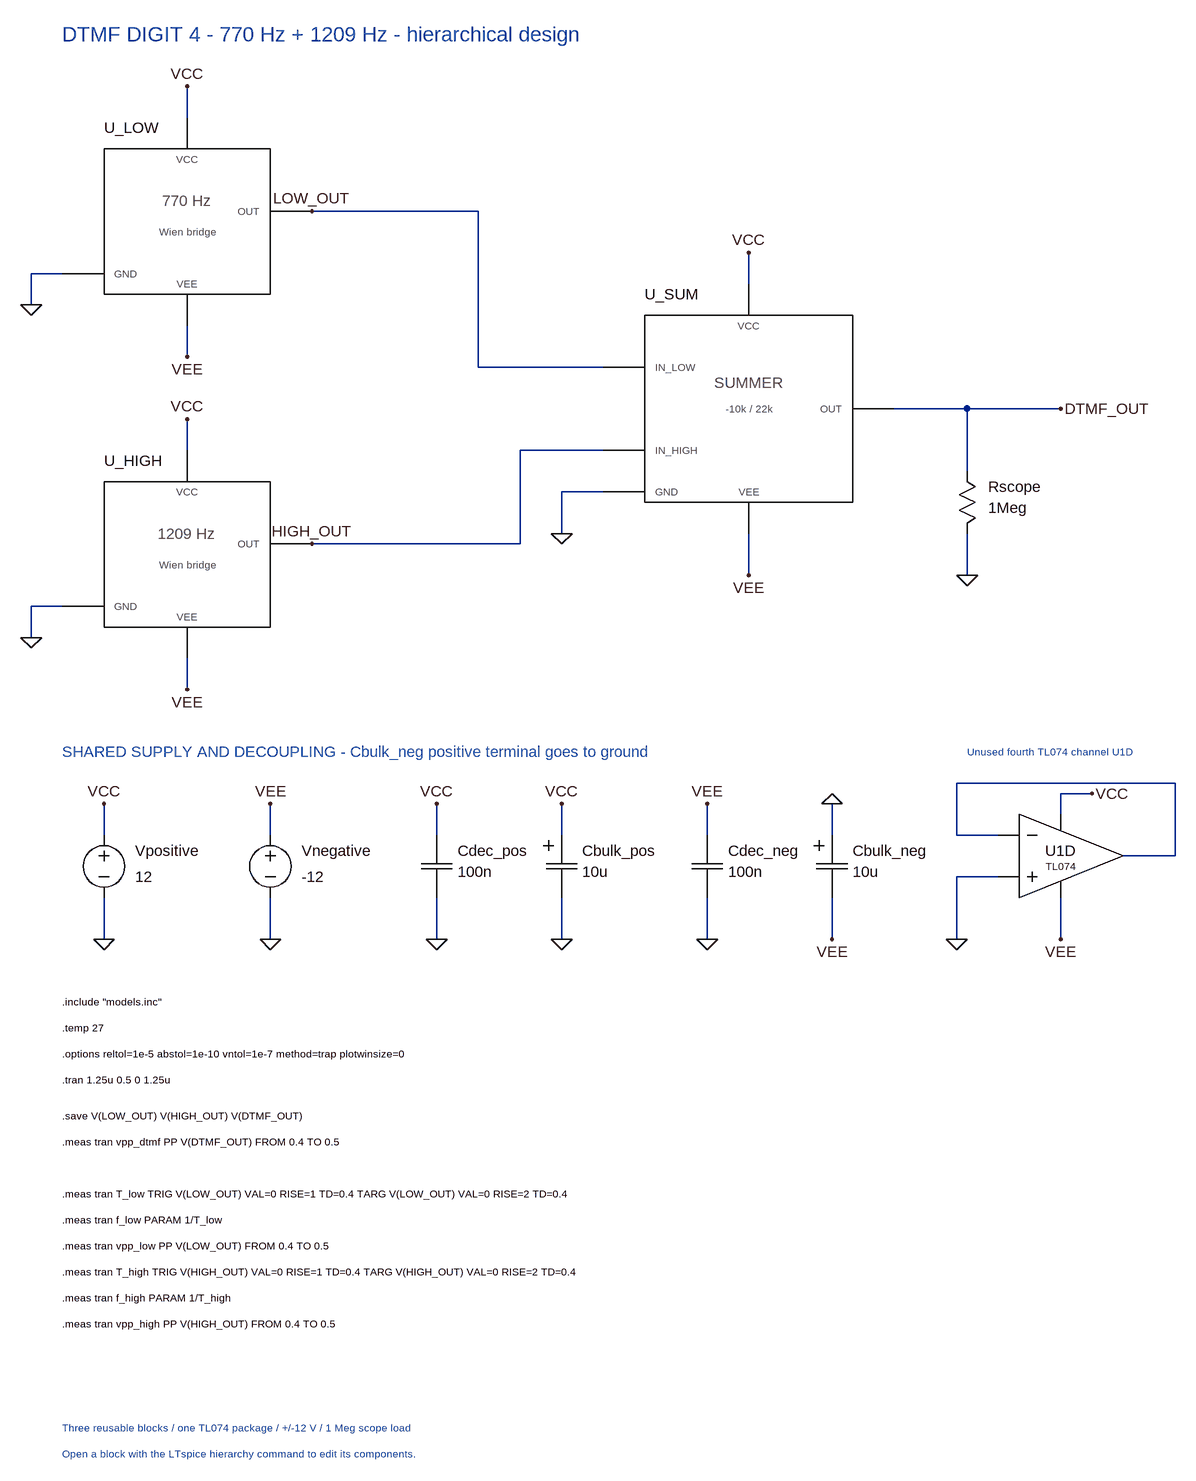
[diagram p0: schematic DTMF4.asc]
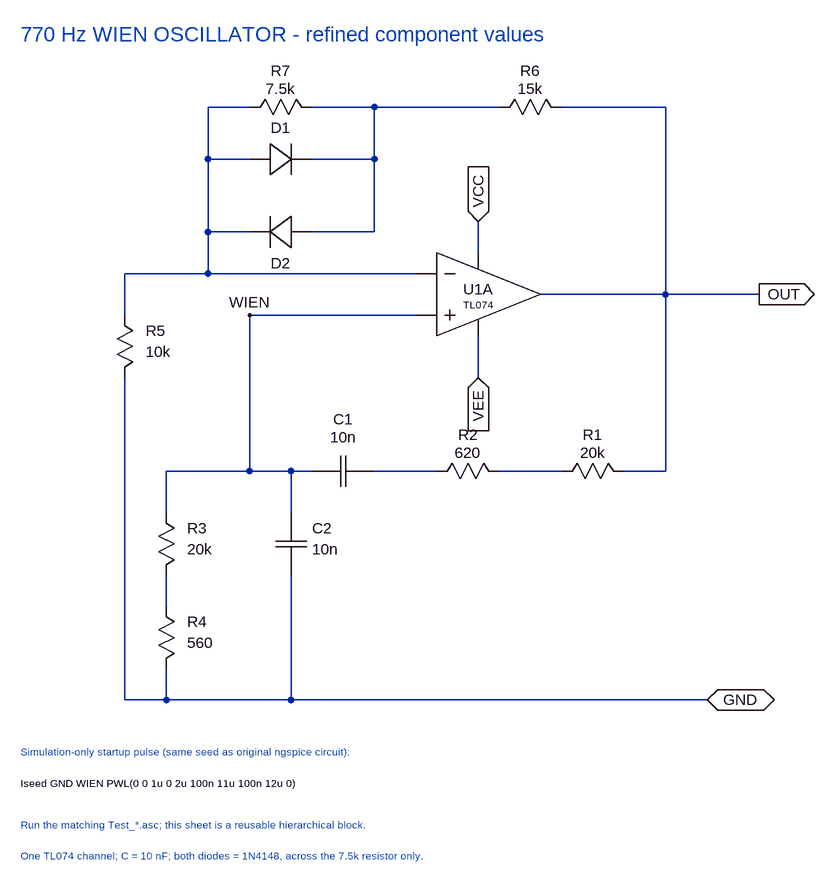
[diagram p1: sub-circuit lowoscillator.asc]
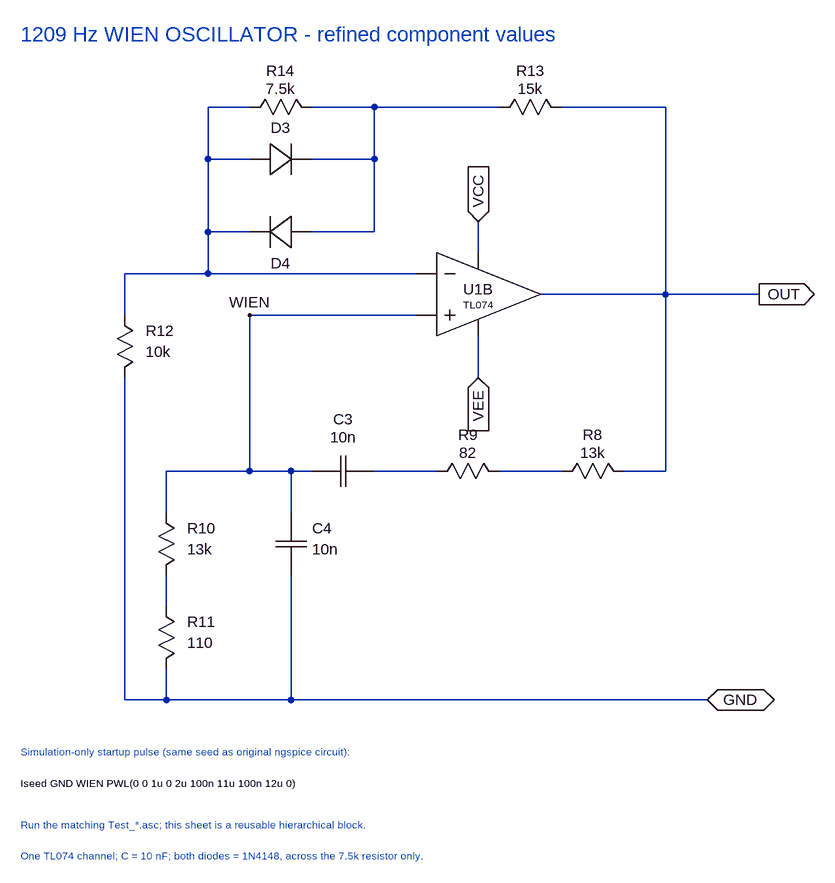
[diagram p2: sub-circuit highoscillator.asc]
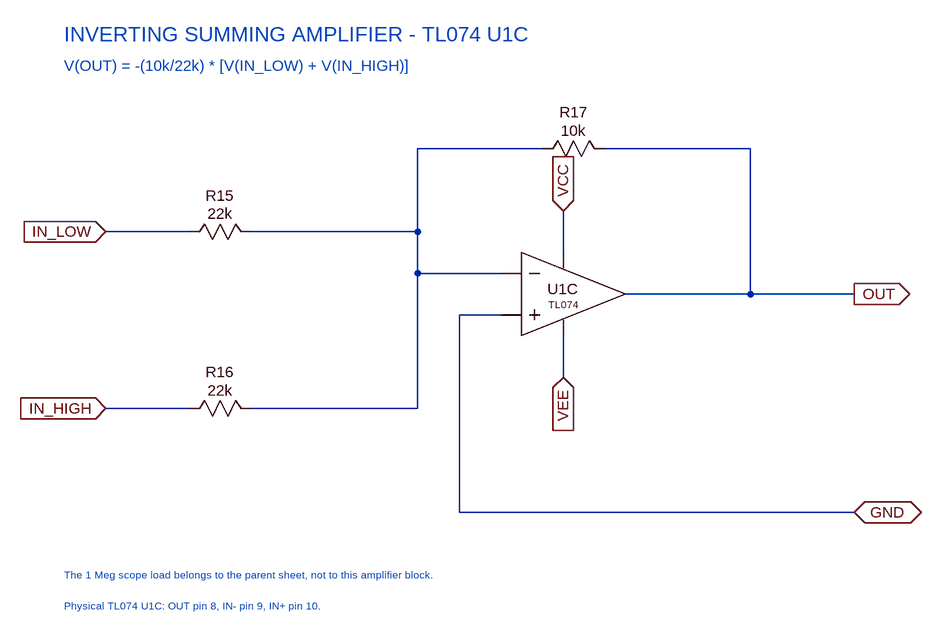
[diagram p3: sub-circuit summingamplifier.asc]
DTMF4.asc, the LTspice schematic file:
Version 4
SHEET 1 2208 2256
WIRE 256 144 256 96
WIRE 256 464 256 512
WIRE 64 384 16 384
WIRE 16 384 16 432
WIRE 256 656 256 608
WIRE 256 976 256 1024
WIRE 64 896 16 896
WIRE 16 896 16 944
WIRE 1120 400 1120 352
WIRE 1120 784 1120 848
WIRE 896 720 832 720
WIRE 832 720 832 784
WIRE 448 288 704 288
WIRE 704 288 704 528
WIRE 704 528 896 528
WIRE 448 800 768 800
WIRE 768 800 768 656
WIRE 768 656 896 656
WIRE 1344 592 1456 592
WIRE 1456 592 1600 592
WIRE 1456 592 1456 688
WIRE 1456 784 1456 848
WIRE 128 1248 128 1200
WIRE 128 1344 128 1408
WIRE 384 1248 384 1200
WIRE 384 1344 384 1408
WIRE 640 1248 640 1200
WIRE 640 1344 640 1408
WIRE 832 1248 832 1200
WIRE 832 1344 832 1408
WIRE 1056 1248 1056 1200
WIRE 1056 1344 1056 1408
WIRE 1248 1248 1248 1200
WIRE 1248 1344 1248 1408
WIRE 1504 1248 1440 1248
WIRE 1440 1248 1440 1168
WIRE 1440 1168 1776 1168
WIRE 1776 1168 1776 1280
WIRE 1776 1280 1696 1280
WIRE 1504 1312 1440 1312
WIRE 1440 1312 1440 1408
WIRE 1600 1216 1600 1184
WIRE 1600 1184 1648 1184
WIRE 1600 1344 1600 1408
FLAG 256 96 VCC
FLAG 256 512 VEE
FLAG 16 432 0
FLAG 448 288 LOW_OUT
FLAG 256 608 VCC
FLAG 256 1024 VEE
FLAG 16 944 0
FLAG 448 800 HIGH_OUT
FLAG 1120 352 VCC
FLAG 1120 848 VEE
FLAG 832 784 0
FLAG 1600 592 DTMF_OUT
FLAG 1456 848 0
FLAG 128 1200 VCC
FLAG 128 1408 0
FLAG 384 1200 VEE
FLAG 384 1408 0
FLAG 640 1200 VCC
FLAG 640 1408 0
FLAG 832 1200 VCC
FLAG 832 1408 0
FLAG 1056 1200 VEE
FLAG 1056 1408 0
FLAG 1248 1200 0
FLAG 1248 1408 VEE
FLAG 1440 1408 0
FLAG 1648 1184 VCC
FLAG 1600 1408 VEE
SYMBOL LowOscillator 128 192 R0
SYMATTR InstName U_LOW
SYMBOL HighOscillator 128 704 R0
SYMATTR InstName U_HIGH
SYMBOL SummingAmplifier 960 448 R0
SYMATTR InstName U_SUM
SYMBOL R_V 1456 688 R0
SYMATTR InstName Rscope
SYMATTR Value 1Meg
SYMBOL V_Source 128 1248 R0
SYMATTR InstName Vpositive
SYMATTR Value 12
SYMBOL V_Source 384 1248 R0
SYMATTR InstName Vnegative
SYMATTR Value -12
SYMBOL C_V 640 1248 R0
SYMATTR InstName Cdec_pos
SYMATTR Value 100n
SYMBOL C_Polar_V 832 1248 R0
SYMATTR InstName Cbulk_pos
SYMATTR Value 10u
SYMBOL C_V 1056 1248 R0
SYMATTR InstName Cdec_neg
SYMATTR Value 100n
SYMBOL C_Polar_V 1248 1248 R0
SYMATTR InstName Cbulk_neg
SYMATTR Value 10u
SYMBOL TL074_Channel 1504 1216 R0
SYMATTR InstName U1D
TEXT 64 16 Left 3 ;DTMF DIGIT 4 - 770 Hz + 1209 Hz - hierarchical design
TEXT 64 2160 Left 1 ;Three reusable blocks / one TL074 package / +/-12 V / 1 Meg scope load
TEXT 64 1120 Left 2 ;SHARED SUPPLY AND DECOUPLING - Cbulk_neg positive terminal goes to ground
TEXT 1456 1120 Left 1 ;Unused fourth TL074 channel U1D
TEXT 64 1504 Left 1 !.include "models.inc"
TEXT 64 1544 Left 1 !.temp 27
TEXT 64 1584 Left 1 !.options reltol=1e-5 abstol=1e-10 vntol=1e-7 method=trap plotwinsize=0
TEXT 64 1624 Left 1 !.tran 1.25u 0.5 0 1.25u
TEXT 64 1680 Left 1 !.save V(LOW_OUT) V(HIGH_OUT) V(DTMF_OUT)
TEXT 64 1800 Left 1 !.meas tran T_low TRIG V(LOW_OUT) VAL=0 RISE=1 TD=0.4 TARG V(LOW_OUT) VAL=0 RISE=2 TD=0.4
TEXT 64 1840 Left 1 !.meas tran f_low PARAM 1/T_low
TEXT 64 1880 Left 1 !.meas tran vpp_low PP V(LOW_OUT) FROM 0.4 TO 0.5
TEXT 64 1920 Left 1 !.meas tran T_high TRIG V(HIGH_OUT) VAL=0 RISE=1 TD=0.4 TARG V(HIGH_OUT) VAL=0 RISE=2 TD=0.4
TEXT 64 1960 Left 1 !.meas tran f_high PARAM 1/T_high
TEXT 64 2000 Left 1 !.meas tran vpp_high PP V(HIGH_OUT) FROM 0.4 TO 0.5
TEXT 64 1720 Left 1 !.meas tran vpp_dtmf PP V(DTMF_OUT) FROM 0.4 TO 0.5
TEXT 64 2200 Left 1 ;Open a block with the LTspice hierarchy command to edit its components.

lowoscillator.asc, the sub-circuit schematic file:
Version 4
SHEET 1 1344 1328
WIRE 864 416 1056 416
WIRE 1056 416 1200 416
WIRE 1056 416 1056 128
WIRE 1056 128 896 128
WIRE 800 128 608 128
WIRE 608 128 512 128
WIRE 416 128 352 128
WIRE 352 128 352 208
WIRE 352 208 352 320
WIRE 352 320 352 384
WIRE 352 384 672 384
WIRE 352 208 416 208
WIRE 512 208 608 208
WIRE 352 320 416 320
WIRE 512 320 608 320
WIRE 608 128 608 208
WIRE 608 208 608 320
WIRE 352 384 224 384
WIRE 224 384 224 448
WIRE 224 544 224 1040
WIRE 1056 416 1056 688
WIRE 1056 688 992 688
WIRE 896 688 800 688
WIRE 704 688 608 688
WIRE 512 688 480 688
WIRE 480 688 416 688
WIRE 416 688 288 688
WIRE 288 688 288 752
WIRE 416 688 416 448
WIRE 416 448 672 448
WIRE 288 848 288 896
WIRE 288 992 288 1040
WIRE 480 688 480 752
WIRE 480 848 480 1040
WIRE 224 1040 288 1040
WIRE 288 1040 480 1040
WIRE 480 1040 1120 1040
WIRE 768 352 768 304
WIRE 768 480 768 544
FLAG 1200 416 OUT
FLAG 416 448 WIEN
FLAG 1120 1040 GND
FLAG 768 304 VCC
FLAG 768 544 VEE
IOPIN 1200 416 Out
IOPIN 1120 1040 BiDir
IOPIN 768 304 In
IOPIN 768 544 In
SYMBOL TL074_Channel 672 352 R0
SYMATTR InstName U1A
SYMBOL R_H 800 128 R0
SYMATTR InstName R6
SYMATTR Value 15k
SYMBOL R_H 416 128 R0
SYMATTR InstName R7
SYMATTR Value 7.5k
SYMBOL Diode_1N4148 416 208 R0
SYMATTR InstName D1
SYMBOL Diode_1N4148 512 320 R180
SYMATTR InstName D2
SYMBOL R_V 224 448 R0
SYMATTR InstName R5
SYMATTR Value 10k
SYMBOL R_H 896 688 R0
SYMATTR InstName R1
SYMATTR Value 20k
SYMBOL R_H 704 688 R0
SYMATTR InstName R2
SYMATTR Value 620
SYMBOL C_H 512 688 R0
SYMATTR InstName C1
SYMATTR Value 10n
SYMBOL R_V 288 752 R0
SYMATTR InstName R3
SYMATTR Value 20k
SYMBOL R_V 288 896 R0
SYMATTR InstName R4
SYMATTR Value 560
SYMBOL C_V 480 752 R0
SYMATTR InstName C2
SYMATTR Value 10n
TEXT 64 16 Left 3 ;770 Hz WIEN OSCILLATOR - refined component values
TEXT 64 1280 Left 1 ;One TL074 channel; C = 10 nF; both diodes = 1N4148, across the 7.5k resistor only.
TEXT 64 1120 Left 1 ;Simulation-only startup pulse (same seed as original ngspice circuit):
TEXT 64 1168 Left 1 !Iseed GND WIEN PWL(0 0 1u 0 2u 100n 11u 100n 12u 0)
TEXT 64 1232 Left 1 ;Run the matching Test_*.asc; this sheet is a reusable hierarchical block.

highoscillator.asc, the sub-circuit schematic file:
Version 4
SHEET 1 1344 1328
WIRE 864 416 1056 416
WIRE 1056 416 1200 416
WIRE 1056 416 1056 128
WIRE 1056 128 896 128
WIRE 800 128 608 128
WIRE 608 128 512 128
WIRE 416 128 352 128
WIRE 352 128 352 208
WIRE 352 208 352 320
WIRE 352 320 352 384
WIRE 352 384 672 384
WIRE 352 208 416 208
WIRE 512 208 608 208
WIRE 352 320 416 320
WIRE 512 320 608 320
WIRE 608 128 608 208
WIRE 608 208 608 320
WIRE 352 384 224 384
WIRE 224 384 224 448
WIRE 224 544 224 1040
WIRE 1056 416 1056 688
WIRE 1056 688 992 688
WIRE 896 688 800 688
WIRE 704 688 608 688
WIRE 512 688 480 688
WIRE 480 688 416 688
WIRE 416 688 288 688
WIRE 288 688 288 752
WIRE 416 688 416 448
WIRE 416 448 672 448
WIRE 288 848 288 896
WIRE 288 992 288 1040
WIRE 480 688 480 752
WIRE 480 848 480 1040
WIRE 224 1040 288 1040
WIRE 288 1040 480 1040
WIRE 480 1040 1120 1040
WIRE 768 352 768 304
WIRE 768 480 768 544
FLAG 1200 416 OUT
FLAG 416 448 WIEN
FLAG 1120 1040 GND
FLAG 768 304 VCC
FLAG 768 544 VEE
IOPIN 1200 416 Out
IOPIN 1120 1040 BiDir
IOPIN 768 304 In
IOPIN 768 544 In
SYMBOL TL074_Channel 672 352 R0
SYMATTR InstName U1B
SYMBOL R_H 800 128 R0
SYMATTR InstName R13
SYMATTR Value 15k
SYMBOL R_H 416 128 R0
SYMATTR InstName R14
SYMATTR Value 7.5k
SYMBOL Diode_1N4148 416 208 R0
SYMATTR InstName D3
SYMBOL Diode_1N4148 512 320 R180
SYMATTR InstName D4
SYMBOL R_V 224 448 R0
SYMATTR InstName R12
SYMATTR Value 10k
SYMBOL R_H 896 688 R0
SYMATTR InstName R8
SYMATTR Value 13k
SYMBOL R_H 704 688 R0
SYMATTR InstName R9
SYMATTR Value 82
SYMBOL C_H 512 688 R0
SYMATTR InstName C3
SYMATTR Value 10n
SYMBOL R_V 288 752 R0
SYMATTR InstName R10
SYMATTR Value 13k
SYMBOL R_V 288 896 R0
SYMATTR InstName R11
SYMATTR Value 110
SYMBOL C_V 480 752 R0
SYMATTR InstName C4
SYMATTR Value 10n
TEXT 64 16 Left 3 ;1209 Hz WIEN OSCILLATOR - refined component values
TEXT 64 1280 Left 1 ;One TL074 channel; C = 10 nF; both diodes = 1N4148, across the 7.5k resistor only.
TEXT 64 1120 Left 1 ;Simulation-only startup pulse (same seed as original ngspice circuit):
TEXT 64 1168 Left 1 !Iseed GND WIEN PWL(0 0 1u 0 2u 100n 11u 100n 12u 0)
TEXT 64 1232 Left 1 ;Run the matching Test_*.asc; this sheet is a reusable hierarchical block.

summingamplifier.asc, the sub-circuit schematic file:
Version 4
SHEET 1 1472 1008
WIRE 928 416 1120 416
WIRE 1120 416 1280 416
WIRE 1120 416 1120 192
WIRE 1120 192 896 192
WIRE 800 192 608 192
WIRE 608 192 608 384
WIRE 608 384 736 384
WIRE 128 320 256 320
WIRE 352 320 608 320
WIRE 128 592 256 592
WIRE 352 592 608 592
WIRE 608 592 608 384
WIRE 736 448 672 448
WIRE 672 448 672 752
WIRE 672 752 1280 752
WIRE 832 352 832 288
WIRE 832 480 832 544
FLAG 1280 416 OUT
FLAG 128 320 IN_LOW
FLAG 128 592 IN_HIGH
FLAG 1280 752 GND
FLAG 832 288 VCC
FLAG 832 544 VEE
IOPIN 1280 416 Out
IOPIN 128 320 In
IOPIN 128 592 In
IOPIN 1280 752 BiDir
IOPIN 832 288 In
IOPIN 832 544 In
SYMBOL TL074_Channel 736 352 R0
SYMATTR InstName U1C
SYMBOL R_H 800 192 R0
SYMATTR InstName R17
SYMATTR Value 10k
SYMBOL R_H 256 320 R0
SYMATTR InstName R15
SYMATTR Value 22k
SYMBOL R_H 256 592 R0
SYMATTR InstName R16
SYMATTR Value 22k
TEXT 64 16 Left 3 ;INVERTING SUMMING AMPLIFIER - TL074 U1C
TEXT 64 64 Left 2 ;V(OUT) = -(10k/22k) * [V(IN_LOW) + V(IN_HIGH)]
TEXT 64 848 Left 1 ;The 1 Meg scope load belongs to the parent sheet, not to this amplifier block.
TEXT 64 896 Left 1 ;Physical TL074 U1C: OUT pin 8, IN- pin 9, IN+ pin 10.

The netlist it stands for:
* DTMF4.asc
XU_LOW LOW_OUT VCC VEE 0 lowoscillator
XU_HIGH HIGH_OUT VCC VEE 0 highoscillator
XU_SUM LOW_OUT HIGH_OUT DTMF_OUT VCC VEE 0 summingamplifier
Rscope DTMF_OUT 0 1Meg
Vpositive VCC 0 12
Vnegative VEE 0 -12
Cdec_pos VCC 0 100n
Cbulk_pos VCC 0 10u
Cdec_neg VEE 0 100n
Cbulk_neg 0 VEE 10u
XU1D 0 N001 VCC VEE N001 TL074  ; pins IN+ IN- VCC VEE OUT

* block symbol definitions
.subckt lowoscillator OUT VCC VEE GND
XU1A WIEN N002 VCC VEE OUT TL074  ; pins IN+ IN- VCC VEE OUT
R6 N001 OUT 15k
R7 N002 N001 7.5k
XD1 N002 N001 1N4148  ; pins A K
XD2 N001 N002 1N4148  ; pins A K
R5 N002 GND 10k
R1 N003 OUT 20k
R2 N004 N003 620
C1 WIEN N004 10n
R3 WIEN N005 20k
R4 N005 GND 560
C2 WIEN GND 10n
* 770 Hz WIEN OSCILLATOR - refined component values
* One TL074 channel; C = 10 nF; both diodes = 1N4148, across the 7.5k resistor only.
* Simulation-only startup pulse (same seed as original ngspice circuit):
Iseed GND WIEN PWL(0 0 1u 0 2u 100n 11u 100n 12u 0)
* Run the matching Test_*.asc; this sheet is a reusable hierarchical block.
.ends lowoscillator

.subckt highoscillator OUT VCC VEE GND
XU1B WIEN N002 VCC VEE OUT TL074  ; pins IN+ IN- VCC VEE OUT
R13 N001 OUT 15k
R14 N002 N001 7.5k
XD3 N002 N001 1N4148  ; pins A K
XD4 N001 N002 1N4148  ; pins A K
R12 N002 GND 10k
R8 N003 OUT 13k
R9 N004 N003 82
C3 WIEN N004 10n
R10 WIEN N005 13k
R11 N005 GND 110
C4 WIEN GND 10n
* 1209 Hz WIEN OSCILLATOR - refined component values
* One TL074 channel; C = 10 nF; both diodes = 1N4148, across the 7.5k resistor only.
* Simulation-only startup pulse (same seed as original ngspice circuit):
Iseed GND WIEN PWL(0 0 1u 0 2u 100n 11u 100n 12u 0)
* Run the matching Test_*.asc; this sheet is a reusable hierarchical block.
.ends highoscillator

.subckt summingamplifier IN_LOW IN_HIGH OUT VCC VEE GND
XU1C GND N001 VCC VEE OUT TL074  ; pins IN+ IN- VCC VEE OUT
R17 N001 OUT 10k
R15 IN_LOW N001 22k
R16 IN_HIGH N001 22k
* INVERTING SUMMING AMPLIFIER - TL074 U1C
* V(OUT) = -(10k/22k) * [V(IN_LOW) + V(IN_HIGH)]
* The 1 Meg scope load belongs to the parent sheet, not to this amplifier block.
* Physical TL074 U1C: OUT pin 8, IN- pin 9, IN+ pin 10.
.ends summingamplifier

* DTMF DIGIT 4 - 770 Hz + 1209 Hz - hierarchical design
* Three reusable blocks / one TL074 package / +/-12 V / 1 Meg scope load
* SHARED SUPPLY AND DECOUPLING - Cbulk_neg positive terminal goes to ground
* Unused fourth TL074 channel U1D
.include "models.inc"
.temp 27
.options reltol=1e-5 abstol=1e-10 vntol=1e-7 method=trap plotwinsize=0
.tran 1.25u 0.5 0 1.25u
.save V(LOW_OUT) V(HIGH_OUT) V(DTMF_OUT)
.meas tran T_low TRIG V(LOW_OUT) VAL=0 RISE=1 TD=0.4 TARG V(LOW_OUT) VAL=0 RISE=2 TD=0.4
.meas tran f_low PARAM 1/T_low
.meas tran vpp_low PP V(LOW_OUT) FROM 0.4 TO 0.5
.meas tran T_high TRIG V(HIGH_OUT) VAL=0 RISE=1 TD=0.4 TARG V(HIGH_OUT) VAL=0 RISE=2 TD=0.4
.meas tran f_high PARAM 1/T_high
.meas tran vpp_high PP V(HIGH_OUT) FROM 0.4 TO 0.5
.meas tran vpp_dtmf PP V(DTMF_OUT) FROM 0.4 TO 0.5
* Open a block with the LTspice hierarchy command to edit its components.
.backanno
.end